# EasyEDA Pro project satelitesbol.eprj, board PCB4
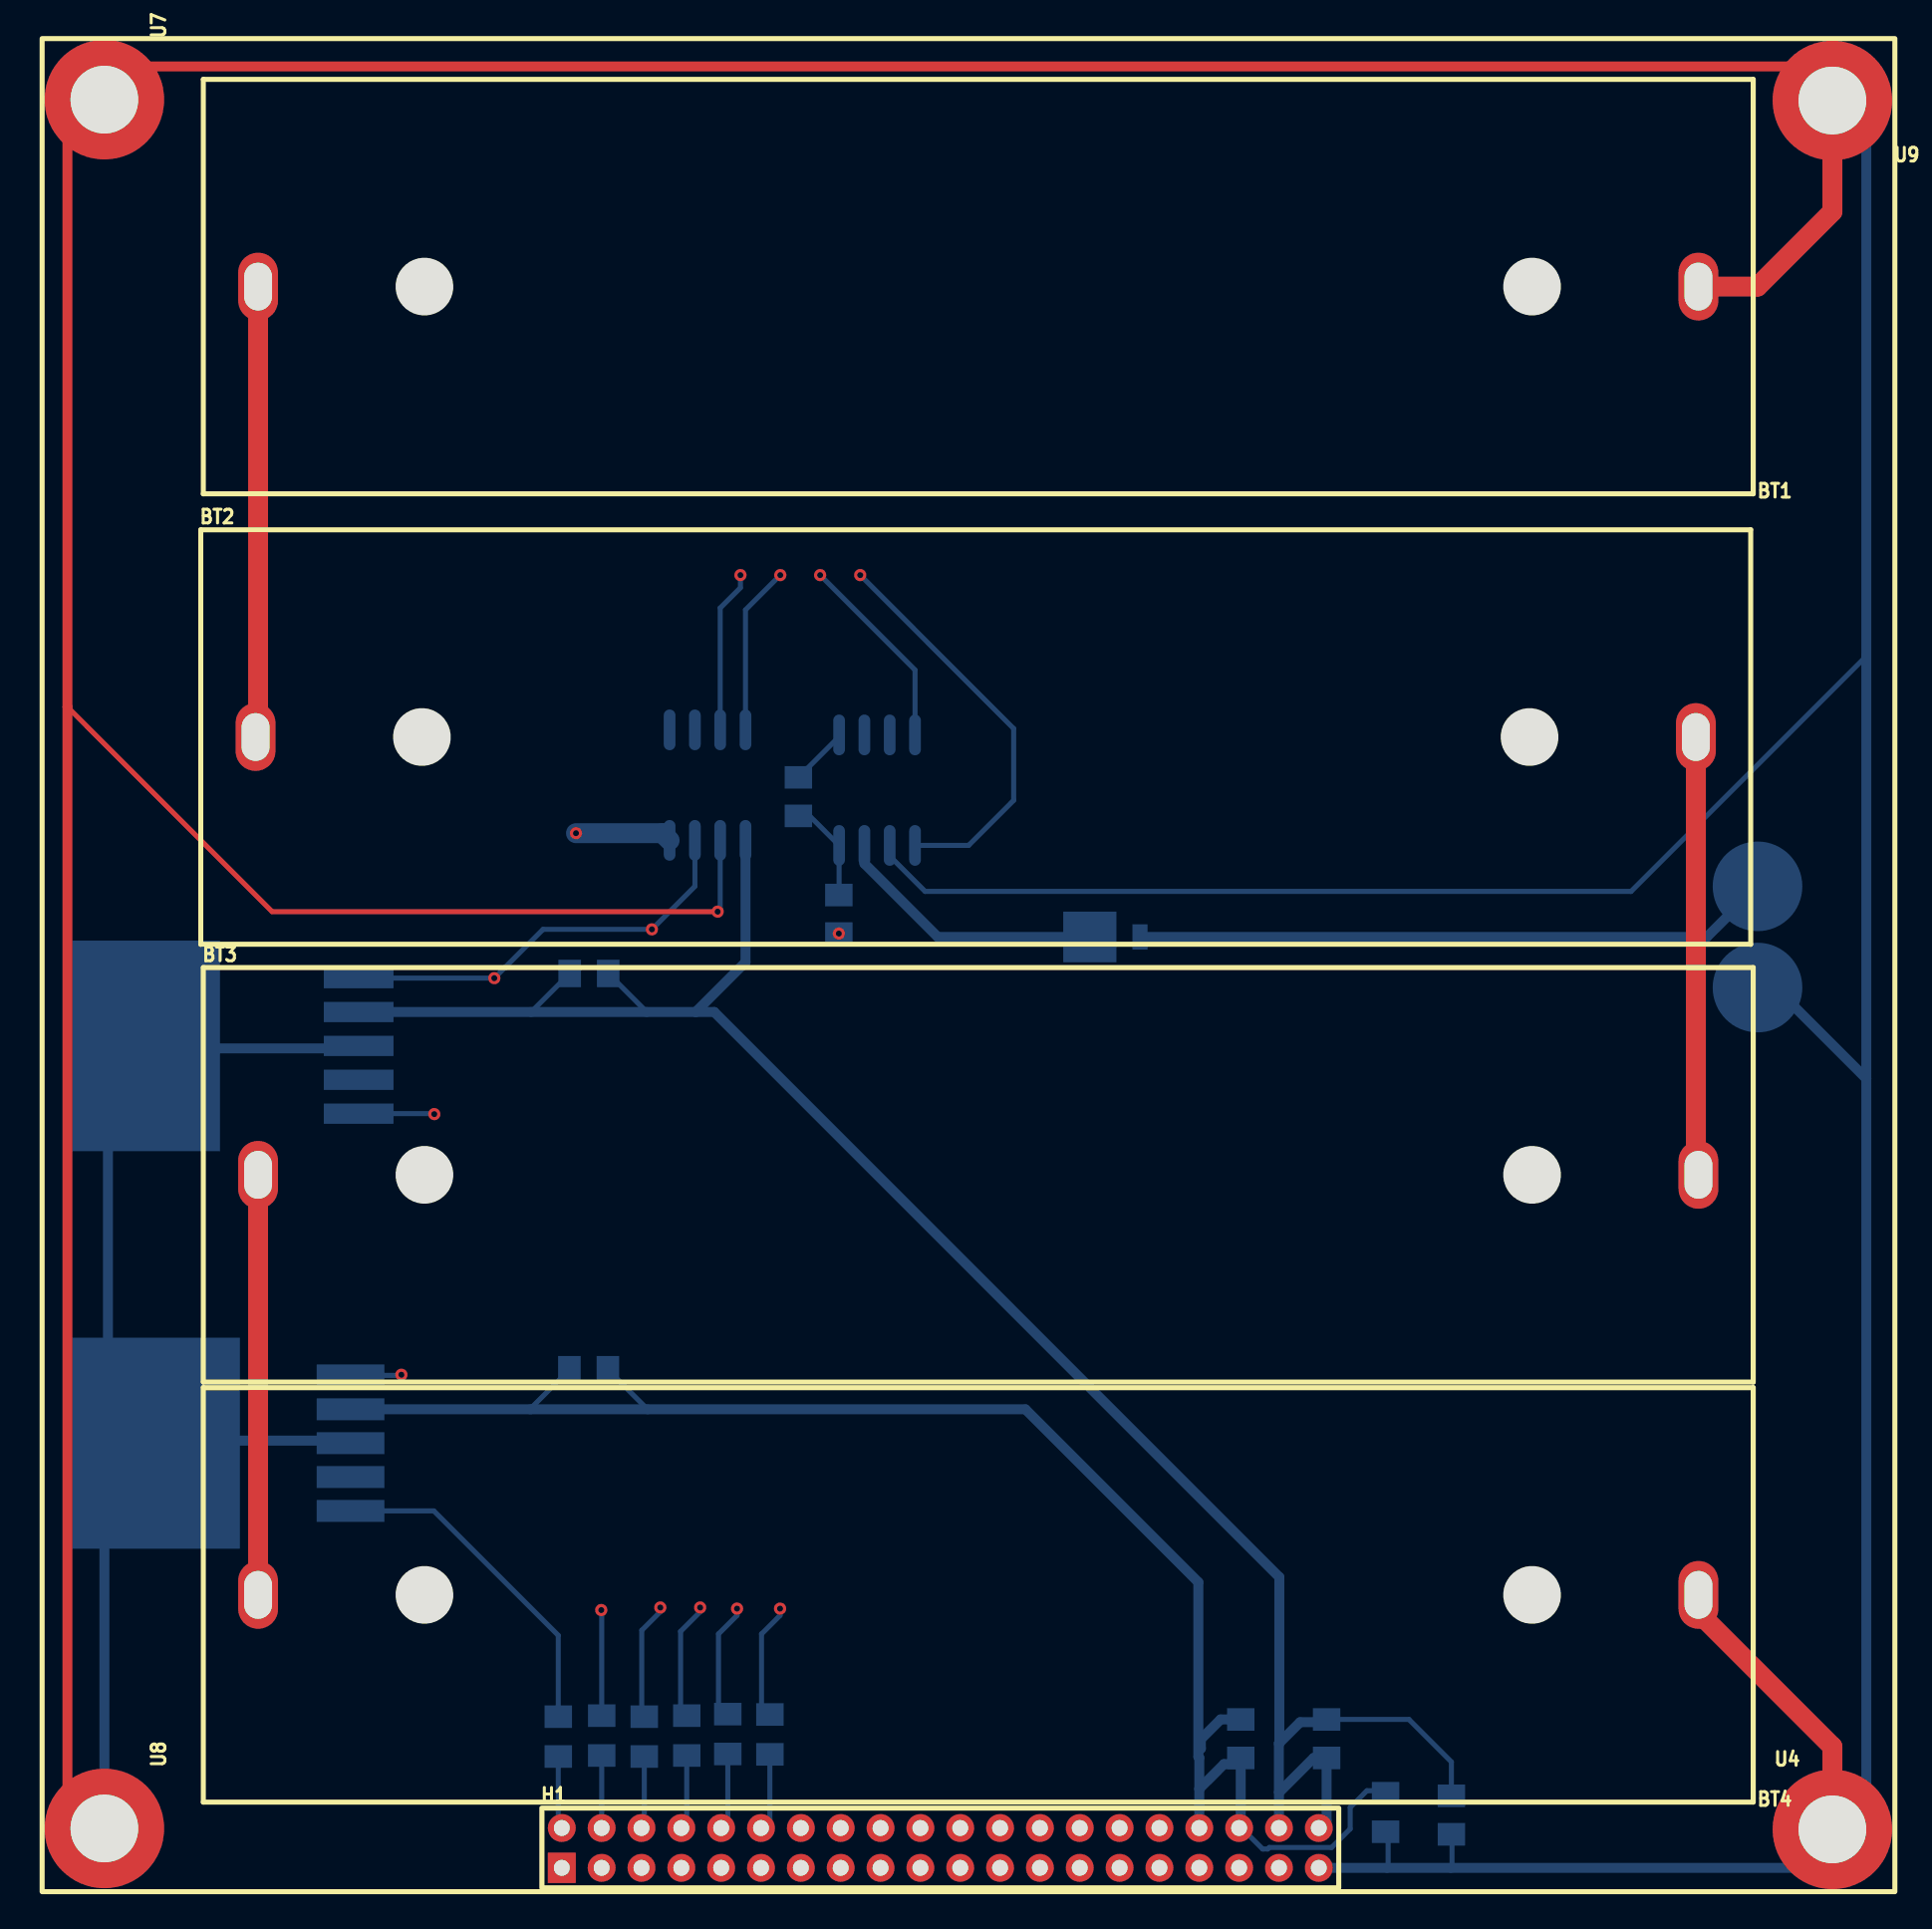
[diagram p4: board, top side]
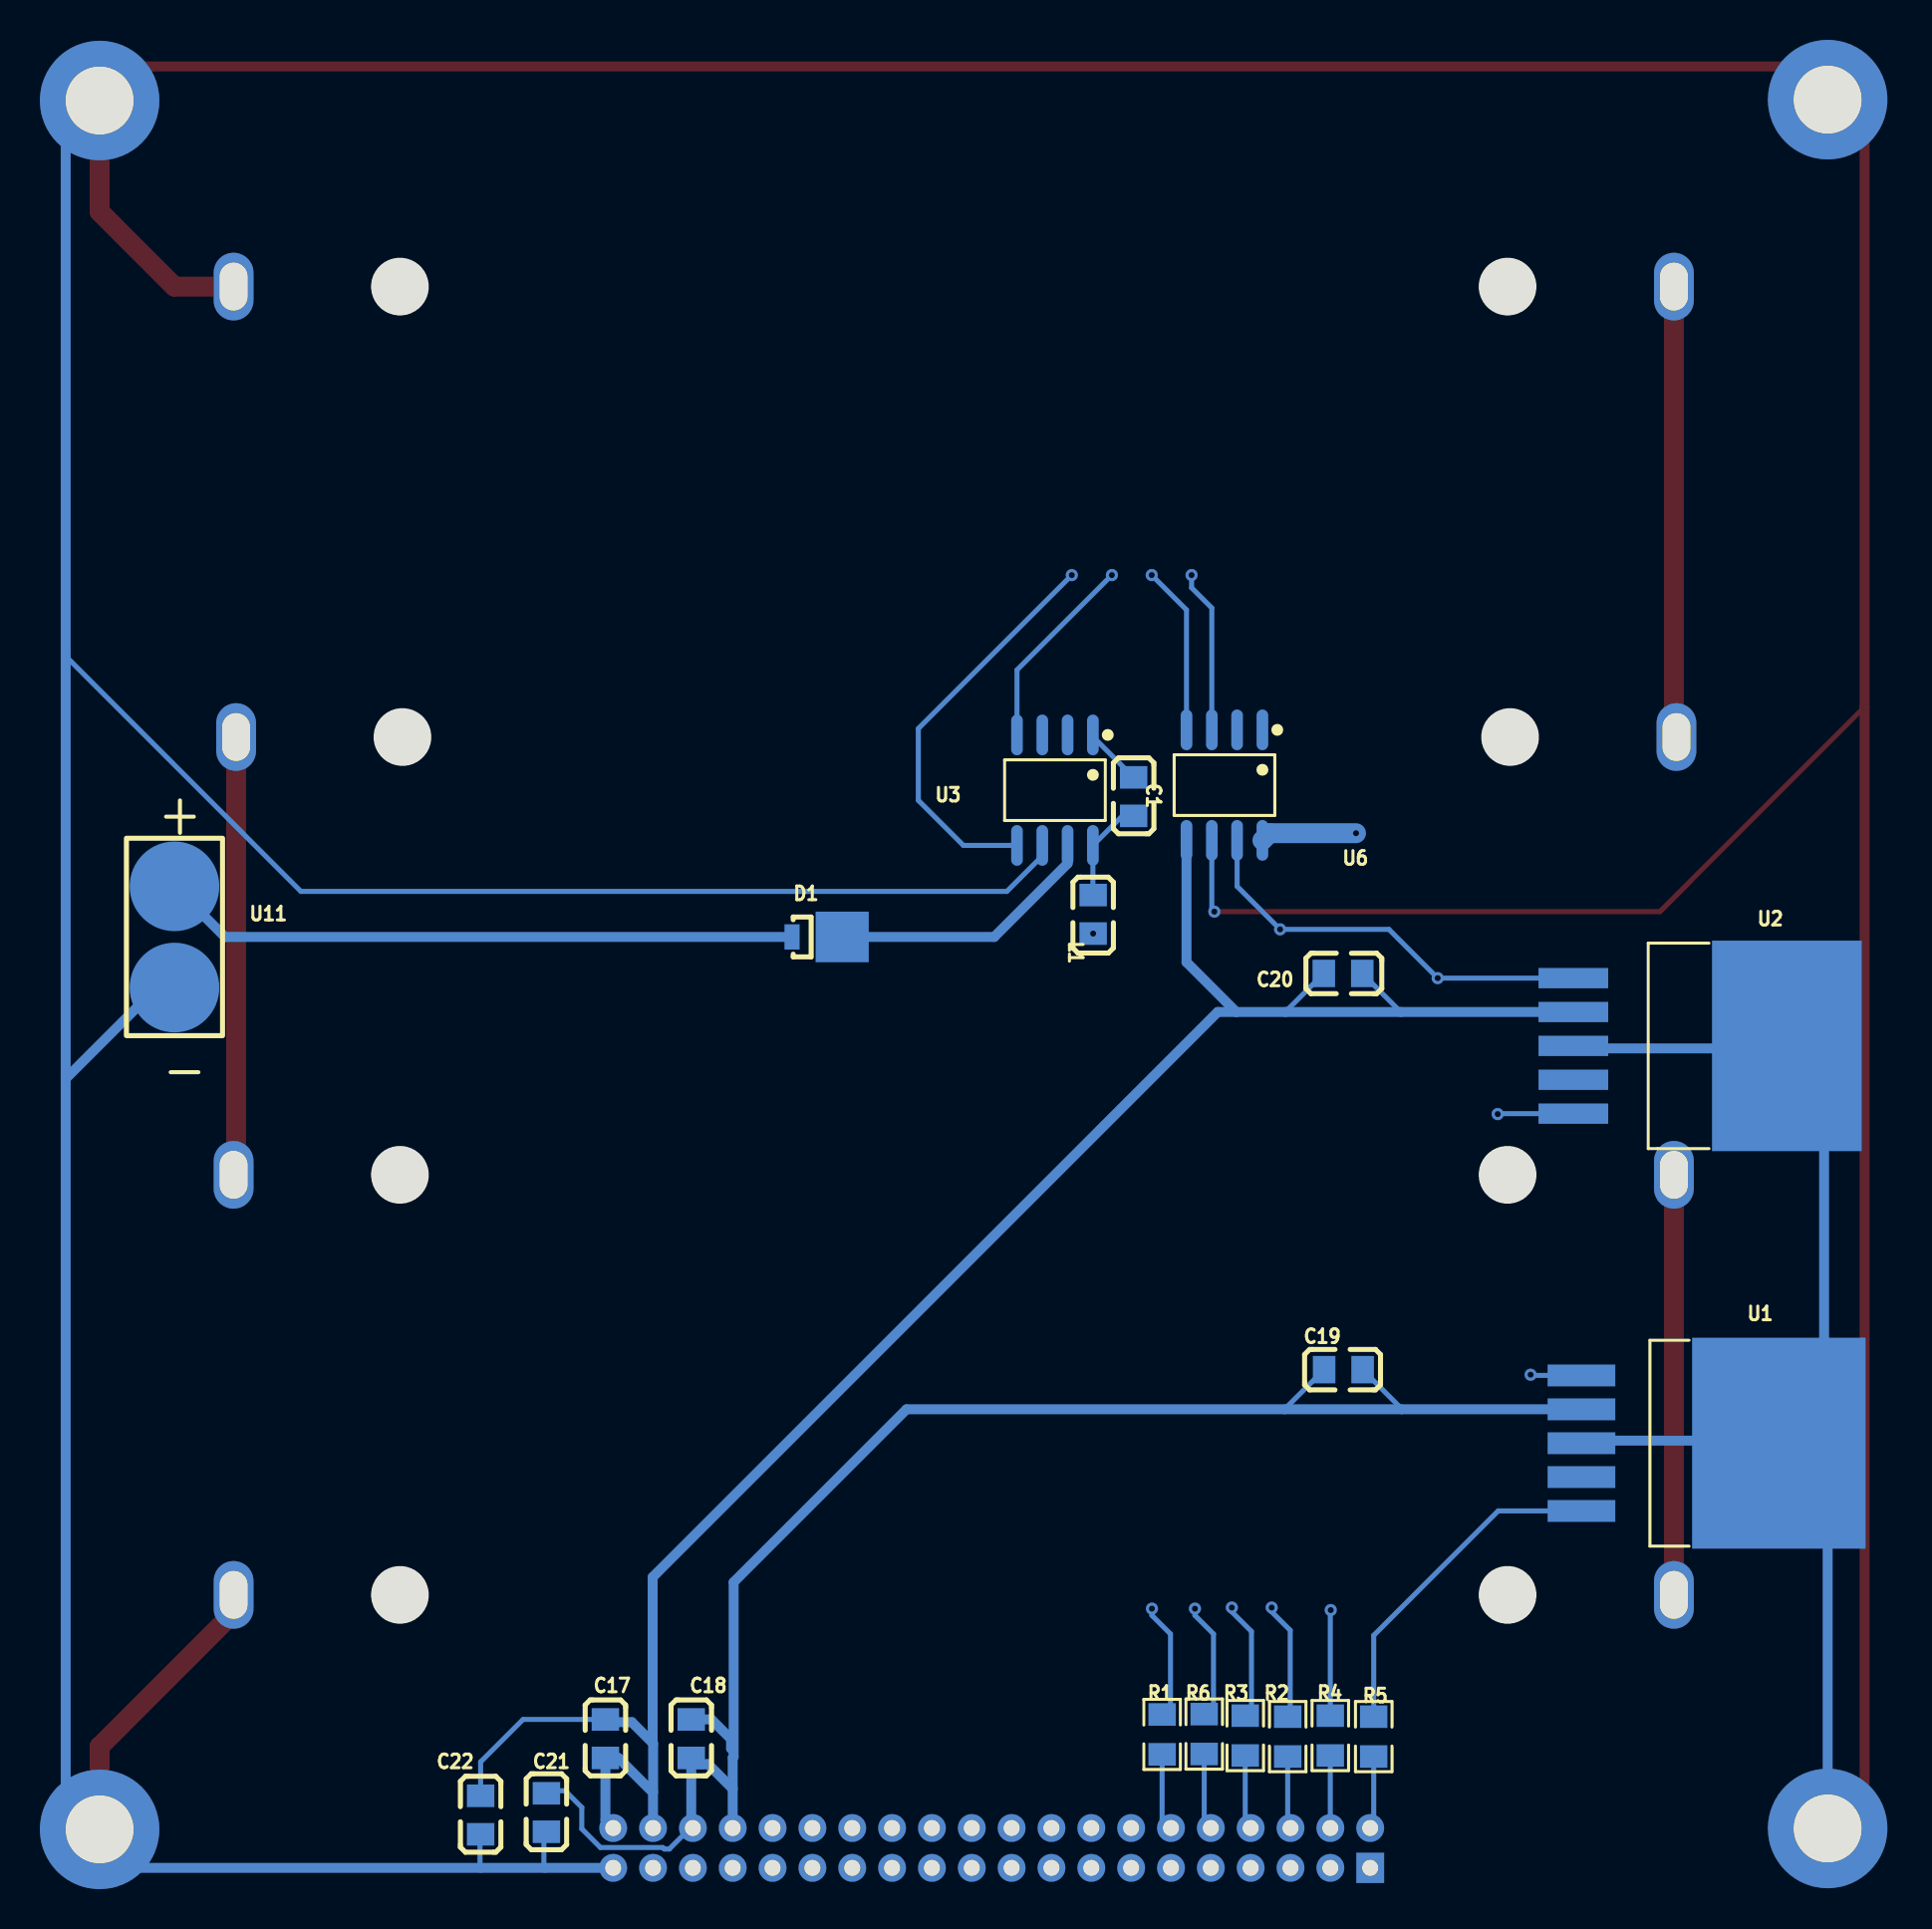
[diagram p5: board, bottom side, seen from below]

Outline 58.62 x 68.55 mm; copper layers: Top Layer, Inner1, Inner2, Bottom Layer. Coordinates in mm from the lower left corner of the outline.
Stack: Top Layer 0.035mm Outer layer thickness 1oz / Dielectric1 0.2104mm 7628 RC49% 8.6mil / Inner1 0.0152mm Inner layer thickness / Dielectric2 1.065mm 1.1mm H/HOZ Copper / Inner2 0.0152mm Inner layer thickness / Dielectric3 0.2104mm 7628 RC49% 8.6mil / Bottom Layer 0.035mm Outer layer thickness 1oz

## Design rules (mm)
template: JLCPCB Capability(Two Layers Board)
spacing copperThickness1oz (default): track to track 0.102, other pairs 0.152 to 0.3
spacing copperThickness2oz: track to track 0.203, other pairs 0.152 to 0.3
track width copperThickness1oz (default): min 0.127, default 0.254, max 2.54
track width copperThickness2oz: min 0.203, default 0.254, max 2.54
differential pair differentialPair (default): width min 0.127, default 0.254, max 2.54; gap min 0.152, default 0.152
via viaSize (default): diameter min 0.5, default 0.61, max 10; hole min 0.3, default 0.305, max 6.3

## Placement (name value [footprint] x y rotation side)
BT1  BH  [BAT-TH_BH-18650-3]  29.37 67.1 180 top
BT2  BH  [BAT-TH_BH-18650-3]  29.25 44.5 0 top
BT3  BH  [BAT-TH_BH-18650-3]  29.37 22.53 0 top
BT4  BH  [BAT-TH_BH-18650-3]  29.37 1.45 180 top
C1  0.1µF  [L0805]  20.34 41.51 270 bottom
C17  0.1 µF  [L0805]  46.86 -5.77 270 bottom
C18  0.1 µF  [L0805]  42.55 -5.77 270 bottom
C19  1000 µF  [L0805]  9.81 12.75 180 bottom
C20  1000 µF  [L0805]  9.83 32.63 0 bottom
C21  0.1µF  [L0805]  49.82 -9.48 270 bottom
C22  0.1µF  [L0805]  53.12 -9.6 270 bottom
D1  SS2P2L-M3/84A  [DO-220AA_L3.4-W2.0-LS3.9-RD]  36.23 34.47 0 bottom
H1  TW-20-03-G-D-315-120  [HDR-TH_40P-P2.00-V-M-R2-C20-S2.00-1]  27.47 -11.25 0 top
L1  15uH  [L0805]  22.38 35.6 90 bottom
R1  10K  [R0805]  18.91 -5.56 90 bottom
R2  10K  [R0805]  12.61 -5.67 90 bottom
R3  10K  [R0805]  14.74 -5.61 90 bottom
R4  10K  [R0805]  10.47 -5.61 90 bottom
R5  10K  [R0805]  8.29 -5.67 90 bottom
R6  10K  [R0805]  16.8 -5.54 90 bottom
U1  LM2596R-5.0 (5 Buck)  [TO-263-5_L10.2-W8.6-P1.70-LS14.4-TL]  -7.09 9.06 180 bottom
U2  LM2596S-3.3 (3.3 buck)  [TO-263-5_L10.2-W8.9-P1.70-LS15.0-BR]  -7.09 29 0 bottom
U3  TPS5420DR (MPPT Solar)  [SOIC-8_L4.9-W3.9-P1.27-LS6.0-BL]  24.29 41.83 0 bottom
U4  -  [M_H]  72.25 -10.32 0 top
U6  INA219AID  [SOIC-8_L4.9-W3.9-P1.27-LS6.0-BL]  15.78 42.09 0 bottom
U7  -  [M_H]  -14.49 76.49 270 top
U8  -  [M_H]  -14.49 -10.28 270 top
U9  -  [M_H]  72.25 76.44 180 top
U11  -  [MG]  68.49 34.47 0 bottom

## Footprints (pads in the part's own frame, mm; a bottom-side part is the same pattern mirrored in y, then rotated)
BAT-TH_BH-18650-3
  oval 2x3.4 hole 1.4x2.4: 1(-36.15,0) 2(36.15,0)
DO-220AA_L3.4-W2.0-LS3.9-RD
  rect 2.67x2.54 smd: 1(-1.258,0)
  rect 0.762x1.27 smd: 2(1.258,0)
HDR-TH_40P-P2.00-V-M-R2-C20-S2.00-1
  rect 1.4x1.524 hole 0.8: 1(-19,-1)
  round 1.4 hole 0.8: 2(-19,1) 3(-17,-1) 4(-17,1) 5(-15,-1) 6(-15,1) 7(-13,-1) 8(-13,1) 9(-11,-1) 10(-11,1) 11(-9,-1) 12(-9,1) 13(-7,-1) 14(-7,1) 15(-5,-1) 16(-5,1) 17(-3,-1) 18(-3,1) 19(-1,-1) 20(-1,1) 21(1,-1) 22(1,1) 23(3,-1) 24(3,1) 25(5,-1) 26(5,1) 27(7,-1) 28(7,1) 29(9,-1) 30(9,1) 31(11,-1) 32(11,1) 33(13,-1) 34(13,1) 35(15,-1) 36(15,1) 37(17,-1) 38(17,1) 39(19,-1) 40(19,1)
L0805
  rect 1.133x1.377 smd: 1(-0.966,0) 2(0.966,0)
M_H
  round 6 hole 3.4: 1(0,0)
MG
  round 4.5 smd: 1(0,2.54) 2(0,-2.54)
R0805
  rect 1.133x1.377 smd: 1(-1,0) 2(1,0)
SOIC-8_L4.9-W3.9-P1.27-LS6.0-BL
  oval 0.588x2.045 smd: 1(-1.905,-2.772) 2(-0.635,-2.772) 3(0.635,-2.772) 4(1.905,-2.772) 5(1.905,2.772) 6(0.635,2.772) 7(-0.635,2.772) 8(-1.905,2.772)
TO-263-5_L10.2-W8.6-P1.70-LS14.4-TL
  rect 3.4x1.1 smd: 1(-4.953,3.4) 2(-4.953,1.7) 3(-4.953,0) 4(-4.953,-1.7) 5(-4.953,-3.4)
  rect 8.705x10.587 smd: 6(4.953,0)
TO-263-5_L10.2-W8.9-P1.70-LS15.0-BR
  rect 3.5x1.02 smd: 1(5.36,-3.4) 2(5.36,-1.7) 3(5.36,0) 4(5.36,1.7) 5(5.36,3.4)
  rect 7.521x10.566 smd: 6(-5.36,0)

## Nets
As in the schematic, except:
GND: BT1.1 BT4.1 C21.2 C22.2 H1.39 U1.3 U1.6 U2.3 U2.6 U3.6 U4.1 U6.6 U7.1 U8.1 U9.1 U11.1

Pads without a net: H1 1 3 5 7 9 11 13 14 15 16 17 18 19 20 21 22 23 24 25 26 27 28 29 30 31 32 33 35 37; U1 4; U2 4; U3 2 3; U6 1 2

## Via types
v1: diameter 0.61, hole 0.305, Top Layer to Bottom Layer, 16 vias

## Routing (per net, layer and track width the routed paths; a pad name or vN(x,y) marks a point on that pad's centre or on a via; arc(x,y) is an arc through that point)
GND: length 488.2
  Top Layer w0.254: -16.35,46.01 -6.07,35.74 v1(16.29,35.74)
  Top Layer w0.5: U9.1 70.54,78.15 -12.83,78.15 U7.1 -16.35,74.63 -16.35,-8.42 U8.1
  Top Layer w1: U9.1 72.25,70.86 68.49,67.1 BT1.1 ; 65.52,0.56 72.25,-6.17 U4.1
  Bottom Layer w0.254: U6.6 16.42,35.86 v1(16.29,35.74) ; 53.11,-12.25 53.15,-12.21 53.15,-10.36 ; 49.89,-12.25 49.95,-12.19 49.95,-10.44 ; 73.95,48.56 62.14,36.75 26.71,36.75 24.93,38.53 U3.6
  Bottom Layer w0.5: 73.95,27.35 69.38,31.93 U11.1 ; 73.95,27.35 73.95,74.74 U9.1 ; 73.95,27.35 73.95,-8.62 U4.1 70.32,-12.25 H1.39 ; U8.1 -14.49,7.01 -12.32,9.19 ; -12.32,9.19 -14.32,11.18 -14.32,26.09 -11.53,28.87 -1.63,28.87 ; -12.32,9.19 -1.6,9.19
3.3_VIN: length 103.8
  Bottom Layer w0.254: C17.1 50.99,-4.81 53.12,-6.94 C22.1 ; C20.2 12.72,30.71 12.72,30.7 ; 6.93,30.7 C20.1
  Bottom Layer w0.5: 44.49,-5.99 44.46,-6.01 44.46,-8.42 ; 44.49,-5.99 45.53,-4.94 46.54,-4.94 ; 44.49,-5.99 44.49,2.33 16.12,30.7 15.19,30.7 ; 15.19,30.7 17.69,33.2 U6.5 ; 15.19,30.7 U2.2 ; H1.38 44.47,-8.48 46.21,-6.74 C17.2 46.86,-9.86 H1.40
5_VIN: length 84
  Bottom Layer w0.254: C21.1 49.69,-8.38 48.88,-8.38 48.04,-9.22 48.04,-10.3 47.11,-11.23 43.98,-11.23 43.9,-11.31 43.65,-11.31 42.59,-10.25 H1.36 ; C19.2 6.89,10.79 6.89,10.76 ; C18.2 42.55,-7.05 ; C19.1 12.77,10.76
  Bottom Layer w0.5: C18.1 41.54,-4.81 40.55,-5.79 40.55,-6.26 40.47,-6.34 ; -3.15,10.76 31.74,10.76 40.42,2.08 40.42,-6.68 40.47,-6.73 40.47,-8.29 ; 40.47,-8.29 41.71,-7.05 42.55,-7.05 42.55,-10.17 H1.36 ; 40.47,-8.29 H1.34
$1N1217: length 3
  Bottom Layer w0.254: U3.1 22.39,44.52 20.34,42.47
$1N1224: length 5.2
  Bottom Layer w0.254: C1.2 20.91,40.54 U3.8 22.39,36.58 L1.2
$1N1231: length 69.6
  Inner2 w0.254: v1(17.27,0.76) 21.43,4.92 v1(21.43,52.63)
  Bottom Layer w0.254: v1(21.43,52.63) 26.2,47.86 U3.4 ; 16.46,-4.85 16.33,-4.72 16.33,-0.51 17.27,0.42 v1(17.27,0.76)
$1N1259: length 80
  Inner2 w0.254: v1(19.42,0.76) 23.45,4.78 v1(23.45,52.63)
  Bottom Layer w0.254: U3.5 28.89,39.06 31.15,41.32 31.15,44.92 v1(23.45,52.63) ; v1(19.42,0.76) 19.42,0.42 18.49,-0.51 18.49,-4.72 18.62,-4.85
$1N1874: length 22
  Top Layer w1: BT3.1 -6.78,0.56
$1N1916: length 22.6
  Top Layer w1: BT1.2 -6.78,44.5
$1N2139: length 57.1
  Inner1 w0.254: v1(5.08,32.4) 5.08,17.16 v1(0.42,12.49) ; v1(12.99,34.85) 15.78,32.05 19.79,32.05 v1(22.38,34.64)
  Bottom Layer w0.254: U6.7 15.15,37.01 v1(12.99,34.85) 7.53,34.85 v1(5.08,32.4) U2.1 ; v1(0.42,12.49) 0.38,12.46 U1.1
$1N2144: length 89.5
  Top Layer w1: BT2.2 65.4,22.65 BT3.2
  Inner1 w1: v1(9.18,39.67) 19.34,49.83 60.06,49.83 BT2.2
  Bottom Layer w1: U6.8 13.52,39.67 v1(9.18,39.67)
$1N3715: length 67.6
  Inner2 w0.254: v1(13.41,0.81) 17.43,4.83 v1(17.43,52.63)
  Bottom Layer w0.254: R2.2 12.48,-4.54 12.48,-0.33 13.41,0.6 v1(13.41,0.81) ; v1(17.43,52.63) 17.43,51.99 16.42,50.98 U6.3
$1N3778: length 68
  Inner2 w0.254: v1(15.41,0.81) 19.43,4.83 v1(19.43,52.63)
  Bottom Layer w0.254: v1(19.43,52.63) 17.69,50.88 U6.4 ; 14.56,-4.72 14.43,-4.59 14.43,-0.39 15.41,0.6 v1(15.41,0.81)
$1N3983: length 3.6
  Bottom Layer w0.254: H1.6 12.61,-10.11 R2.1
$1N3987: length 3.8
  Bottom Layer w0.254: H1.8 14.74,-9.98 R3.1
$1N4189: length 13.8
  Bottom Layer w0.5: D1.1 27.34,34.47 23.66,38.15 U3.7
$1N6188: length 3.7
  Bottom Layer w0.254: 8.47,-10.25 8.29,-10.08 R5.1
$1N6202: length 3.6
  Bottom Layer w0.254: R4.1 10.47,-10.25 H1.4
$1N6362: length 32
  Bottom Layer w0.5: U11.2 65.95,34.47 37.5,34.47
$1N7172: length 3.9
  Bottom Layer w0.254: R1.1 18.91,-9.81 H1.12
$1N7175: length 3.9
  Bottom Layer w0.254: R6.1 16.8,-9.92 H1.10
$1N7279: length 37.5
  Inner2 w0.254: v1(10.45,0.68) 10.45,17.19 v1(2.07,25.58)
  Bottom Layer w0.254: v1(10.45,0.68) 10.47,0.66 R4.2 ; U2.5 2.05,25.6 v1(2.07,25.58)
$1N7286: length 17.1
  Bottom Layer w0.254: U1.5 2.05,5.66 8.29,-0.59 R5.2

## Text on the board
Bottom Silkscreen Layer: - | +
